# EasyEDA Pro project ProProject_25电赛备赛_2025-07-07.epro, board PCB30_1
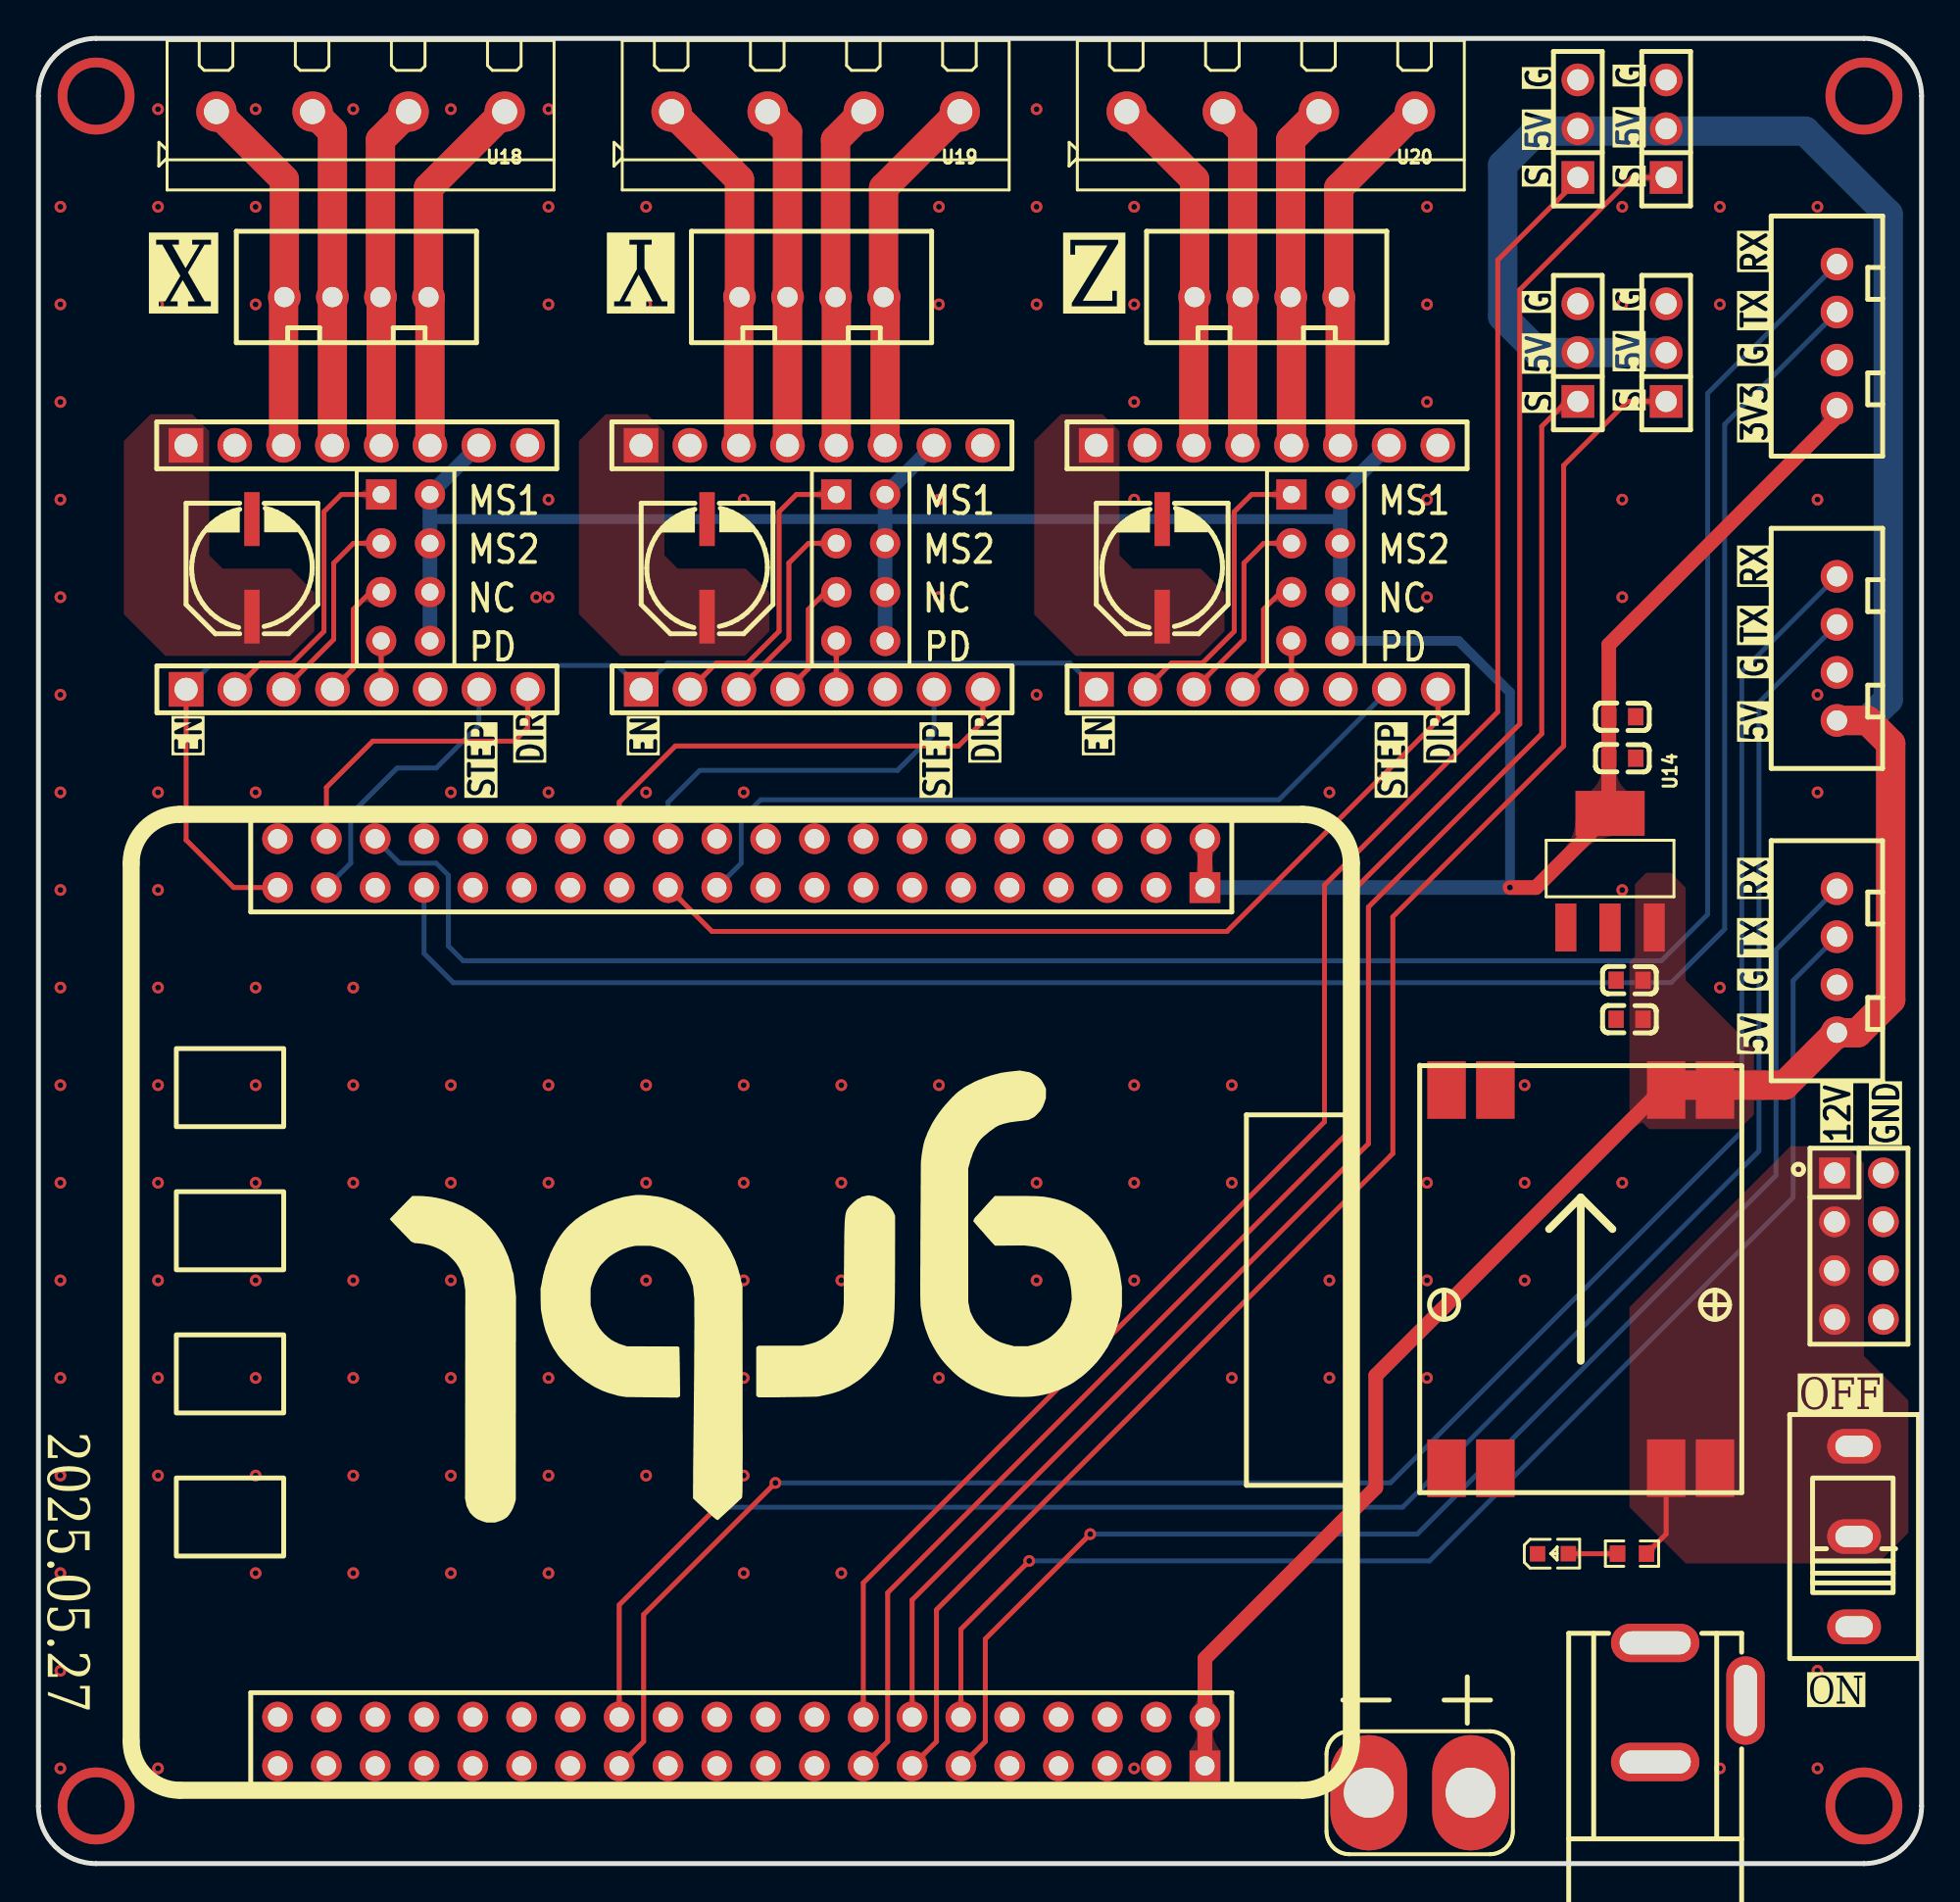
[diagram p4: board, top side]
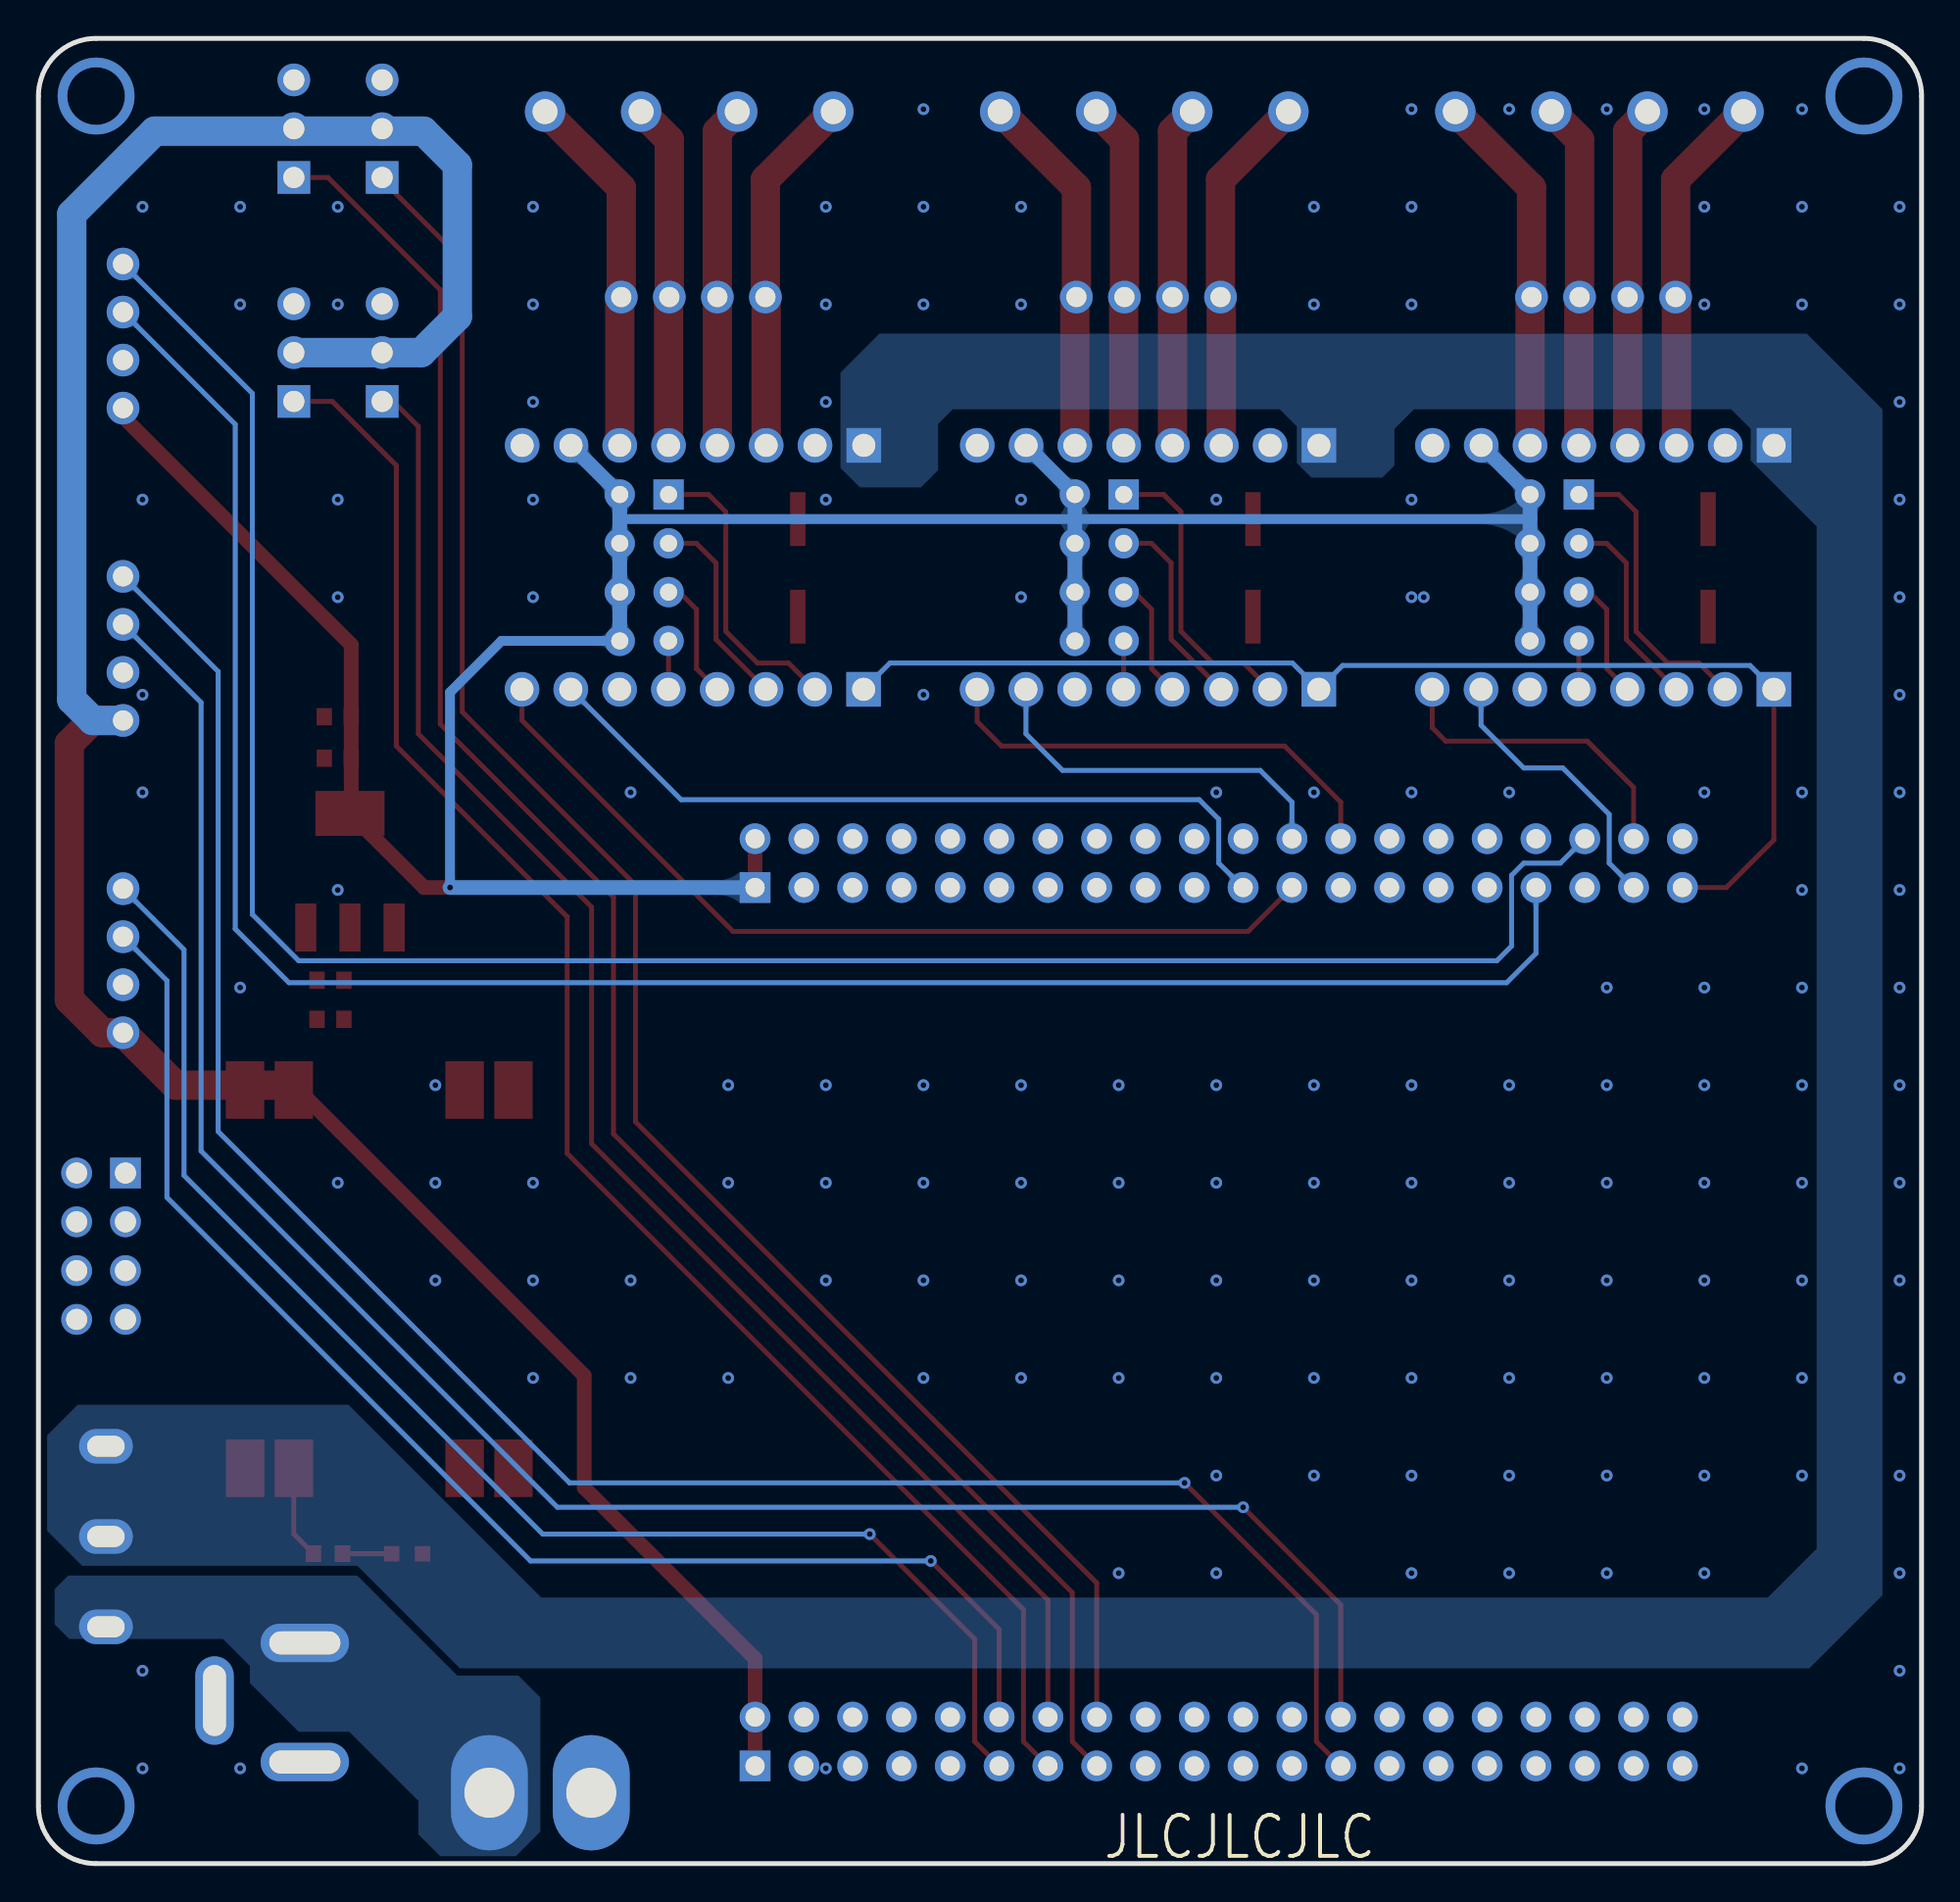
[diagram p5: board, bottom side, seen from below]

Outline 98 x 95 mm; copper layers: Top Layer, Bottom Layer. Coordinates in mm from the lower left corner of the outline.
Outline path: 0,92 0,3 arc(0.88,0.88) 3,0 95,0 arc(97.12,0.88) 98,3 98,92 arc(97.12,94.12) 95,95 3,95 arc(0.88,94.12) 0,92
Stack: Top Layer 0.035mm / Dielectric1 1.51mm FR4 er 4.5 / Bottom Layer 0.035mm

## Design rules (mm)
template: 自定义配置
spacing copperThickness1oz (default): track to track 0.102, other pairs 0.152 to 0.3
spacing copperThickness2oz: track to track 0.203, other pairs 0.152 to 0.3
track width copperThickness1oz (default): min 0.127, default 0.254, max 2.54
track width copperThickness2oz: min 0.203, default 0.254, max 2.54
differential pair differentialPair (default): width min 0.127, default 0.254, max 2.54; gap min 0.152, default 0.152
via viaSize (default): diameter min 0.5, default 0.61, max 10; hole min 0.3, default 0.305, max 6.3

## Placement (name value [footprint] x y rotation side)
C3  100nF  [C0603]  82.8 43.95 0 top
C4  10uF  [C0603]  82.8 45.98 0 top
C41  100nF  [C0603]  82.42 57.53 180 top
C42  10uF  [C0603]  82.42 59.69 180 top
DC2  DC005  [DC-IN-TH_DC005]  86.49 8.39 90 top
DCIN1  T型插头  [wired t-header throughhole]  71.88 3.69 270 top
H1  -  [HDR-TH_8P-P2.54-V-F-R2-C4-S2.54-1]  94.74 32.14 270 top
H2  -  [HDR-TH_3P-P2.54-V-M]  80.11 90.3 90 top
H3  -  [HDR-TH_3P-P2.54-V-M]  84.71 90.3 90 top
H4  -  [HDR-TH_3P-P2.54-V-M]  80.11 78.65 90 top
H5  -  [HDR-TH_3P-P2.54-V-M]  84.71 78.65 90 top
H6  -  [HDR-TH_8P-P2.54-V-F-1]  40.26 61.12 0 top
H7  -  [HDR-TH_8P-P2.54-V-F-1]  40.25 73.82 0 top
H8  -  [HDR-TH_8P-P2.54-V-F-1]  16.58 61.12 0 top
H9  -  [HDR-TH_8P-P2.54-V-F-1]  16.57 73.82 0 top
H10  -  [HDR-TH_8P-P2.54-V-F-1]  63.95 61.12 0 top
H11  -  [HDR-TH_8P-P2.54-V-F-1]  63.94 73.82 0 top
LED1  -  [LED_0603]  78.87 16.13 0 top
MC13  100uF(35V)  [CAP-D6.3XH5.5]  11.11 67.44 270 top
MC14  100uF(35V)  [CAP-D6.3XH5.5]  34.8 67.44 270 top
MC19  100uF(35V)  [CAP-D6.3XH5.5]  58.48 67.44 270 top
MJ1  HDR-M-2.54_2x4  [HDR-M-2.54_2X4]  19.11 67.45 270 top
MJ2  HDR-M-2.54_2x4  [HDR-M-2.54_2X4]  42.79 67.45 270 top
MJ3  HDR-M-2.54_2x4  [HDR-M-2.54_2X4]  66.48 67.45 270 top
R1  10K  [R0603]  82.93 16.13 180 top
U1  336682cdb138453f91beae0ae56ac6f0  [f4核心板]  36.58 29.21 270 top
U2  xh2.54-4p(直针)  [CONN-TH_4P-P2.50-XH2.54-4P]  16.55 81.54 180 top
U3  xh2.54-4p(直针)  [CONN-TH_4P-P2.50-XH2.54-4P]  40.23 81.54 180 top
U4  xh2.54-4p(直针)  [CONN-TH_4P-P2.50-XH2.54-4P]  63.92 81.54 180 top
U6  xh2.54-4p(直针)  [CONN-TH_4P-P2.50-XH2.54-4P]  93.6 46.99 270 top
U7  xh2.54-4p(直针)  [CONN-TH_4P-P2.50-XH2.54-4P]  93.6 63.25 270 top
U8  xh2.54-4p(直针)  [CONN-TH_4P-P2.50-XH2.54-4P]  93.6 79.51 270 top
U9  -  [mp1584]  88.65 19.31 90 top
U14  AMS1117-3.3  [SOT-223-3_L6.5-W3.4-P2.30-LS7.0-BR]  81.79 51.69 270 top
U18  -  [KF301_4P]  16.76 91.19 180 top
U19  -  [KF301_4P]  40.45 91.19 180 top
U20  -  [KF301_4P]  64.13 91.19 180 top
U21  SS-12D10G4  [SW-TH_HOOYA_SS-12D10G4]  94.49 17.02 90 top

## Footprints (pads in the part's own frame, mm; a bottom-side part is the same pattern mirrored in y, then rotated)
C0603
  rect 0.8x0.9 smd: 1(-0.7,0) 2(0.7,0)
CAP-D6.3XH5.5
  rect 2.8x0.8 smd: 1(2.54,0) 2(-2.54,0)
CONN-TH_4P-P2.50-XH2.54-4P
  round 1.7 hole 1.05: 1(3.75,0) 2(1.25,0) 3(-1.25,0) 4(-3.75,0)
DC-IN-TH_DC005
  oval 2x4.6 hole 1.2x3.7: 1(3.1,2.35) 2(-3.1,2.35)
  oval 4.6x2 hole 3.7x1.2: 3(0.1,-2.35)
f4核心板
  rect 1.6x1.6 hole 1: 1(-21.59,24.13) 41(24.13,24.13)
  round 1.6 hole 1: 2(-24.13,24.13) 3(-21.59,21.59) 4(-24.13,21.59) 5(-21.59,19.05) 6(-24.13,19.05) 7(-21.59,16.51) 8(-24.13,16.51) 9(-21.59,13.97) 10(-24.13,13.97) 11(-21.59,11.43) 12(-24.13,11.43) 13(-21.59,8.89) 14(-24.13,8.89) 15(-21.59,6.35) 16(-24.13,6.35) 17(-21.59,3.81) 18(-24.13,3.81) 19(-21.59,1.27) 20(-24.13,1.27) 21(-21.59,-1.27) 22(-24.13,-1.27) 23(-21.59,-3.81) 24(-24.13,-3.81) 25(-21.59,-6.35) 26(-24.13,-6.35) 27(-21.59,-8.89) 28(-24.13,-8.89) 29(-21.59,-11.43) 30(-24.13,-11.43) 31(-21.59,-13.97) 32(-24.13,-13.97) 33(-21.59,-16.51) 34(-24.13,-16.51) 35(-21.59,-19.05) 36(-24.13,-19.05) 37(-21.59,-21.59) 38(-24.13,-21.59) 39(-21.59,-24.13) 40(-24.13,-24.13) 42(21.59,24.13) 43(24.13,21.59) 44(21.59,21.59) 45(24.13,19.05) 46(21.59,19.05) 47(24.13,16.51) 48(21.59,16.51) 49(24.13,13.97) 50(21.59,13.97) 51(24.13,11.43) 52(21.59,11.43) 53(24.13,8.89) 54(21.59,8.89) 55(24.13,6.35) 56(21.59,6.35) 57(24.13,3.81) 58(21.59,3.81) 59(24.13,1.27) 60(21.59,1.27) 61(24.13,-1.27) 62(21.59,-1.27) 63(24.13,-3.81) 64(21.59,-3.81) 65(24.13,-6.35) 66(21.59,-6.35) 67(24.13,-8.89) 68(21.59,-8.89) 69(24.13,-11.43) 70(21.59,-11.43) 71(24.13,-13.97) 72(21.59,-13.97) 73(24.13,-16.51) 74(21.59,-16.51) 75(24.13,-19.05) 76(21.59,-19.05) 77(24.13,-21.59) 78(21.59,-21.59) 79(24.13,-24.13) 80(21.59,-24.13)
HDR-M-2.54_2X4
  rect 1.575x1.575 hole 0.889: 1(-3.81,-1.27)
  round 1.575 hole 0.889: 2(-3.81,1.27) 3(-1.27,-1.27) 4(-1.27,1.27) 5(1.27,-1.27) 6(1.27,1.27) 7(3.81,-1.27) 8(3.81,1.27)
HDR-TH_3P-P2.54-V-M
  rect 1.7x1.7 hole 1.1: 1(-2.54,0)
  round 1.7 hole 1.1: 2(0,0) 3(2.54,0)
HDR-TH_8P-P2.54-V-F-1
  rect 1.8x1.8 hole 1.2: 1(-8.89,0)
  round 1.8 hole 1.2: 2(-6.35,0) 3(-3.81,0) 4(-1.27,0) 5(1.27,0) 6(3.81,0) 7(6.35,0) 8(8.89,0)
HDR-TH_8P-P2.54-V-F-R2-C4-S2.54-1
  rect 1.6x1.6 hole 1.1: 1(-3.81,-1.27)
  round 1.6 hole 1.1: 2(-3.81,1.27) 3(-1.27,-1.27) 4(-1.27,1.27) 5(1.27,-1.27) 6(1.27,1.27) 7(3.81,-1.27) 8(3.81,1.27)
KF301_4P
  round 2.1 hole 1.3: 1(-7.5,0) 2(-2.5,0) 3(2.5,0) 4(7.5,0)
LED_0603
  rect 0.8x0.8 smd: 1(-0.851,-0.01) 2(0.75,-0.005)
mp1584
  rect 3x2 smd: 1(1.27,15.367) 2(1.27,12.827) 3(20.955,15.367) 4(20.955,12.827) 5(1.27,3.937) 6(1.27,1.397) 7(20.955,3.937) 8(20.955,1.397)
R0603
  rect 0.806x0.864 smd: 1(-0.753,0) 2(0.753,0)
SOT-223-3_L6.5-W3.4-P2.30-LS7.0-BR
  rect 2.5x1.1 smd: 1(2.97,-2.3) 2(2.97,0) 3(2.97,2.3)
  rect 2.34x3.6 smd: 4(-2.97,0)
SW-TH_HOOYA_SS-12D10G4
  oval 1.8x2.8 hole 1.1x1.95: 1(-4.7,0) 2(0,0) 3(4.7,0)
wired t-header throughhole
  rrect 6x4 hole 2.6: 1(0,2.65) 2(0,-2.65)

## Nets
3V3: C41.2 C42.2 H7.7 H9.7 H11.7 MJ1.2 MJ1.4 MJ1.6 MJ1.8 MJ2.2 MJ2.4 MJ2.6 MJ2.8 MJ3.2 MJ3.4 MJ3.6 MJ3.8 U1.1 U1.2 U8.1 U14.4
5V: C3.2 C4.2 H2.2 H3.2 H4.2 H5.2 U1.41 U1.42 U6.1 U7.1 U9.7 U9.8 U14.3
GND: C3.1 C4.1 C41.1 C42.1 DC2.2 DC2.3 DCIN1.2 H1.2 H1.4 H1.6 H1.8 H2.3 H3.3 H4.3 H5.3 H6.6 H7.2 H7.8 H8.6 H9.2 H9.8 H10.6 H11.2 H11.8 LED1.1 MC13.2 MC14.2 MC19.2 U1.3 U1.4 U1.43 U1.44 U1.45 U1.77 U1.78 U6.2 U7.2 U8.2 U9.1 U9.2 U9.3 U9.4 U14.1
PVCC: H1.1 H1.3 H1.5 H1.7 H7.1 H9.1 H11.1 MC13.1 MC14.1 MC19.1 R1.1 U9.5 U9.6 U21.2 U21.3
VCC_IN: DC2.1 DCIN1.1 U21.1
PA0: U1.31
PA1: U1.34
PA2: U1.33 U8.3
PA3: U1.36 U8.4
PA4: U1.35
PA5: H8.8 U1.38
PA6: H8.7 U1.37
PA7: U1.40
PA8: U1.48
PA9: U1.47
PA10: U1.46
PA15: U1.6
PB1: U1.76
PB3: U1.18
PB4: U1.17
PB5: U1.20
PB6: U1.19
PB7: U1.22
PB8: H10.7 U1.21
PB9: H6.7 U1.24
PB10: U1.66 U7.3
PB11: U1.65 U7.4
PB12: U1.64
PB13: U1.63
PB14: U1.62
PB15: U1.61
PC4: H6.1 H8.1 H10.1 U1.39
PC6: U1.52 U6.3
PC7: U1.51 U6.4
PC8: U1.50
PC9: U1.49
PC10: U1.5
PC11: U1.8
PC12: U1.7
PC13: U1.32
PD0: U1.10
PD1: U1.9
PD2: U1.12
PD3: U1.11
PD4: U1.14
PD5: U1.13
PD6: U1.16
PD7: U1.15
PD8: U1.60
PD9: U1.59
PD10: U1.58
PD11: U1.57
PD12: H2.1 U1.56
PD13: H3.1 U1.55
PD14: H4.1 U1.54
PD15: H5.1 U1.53
PE0: H10.8 U1.23
PE1: H6.8 U1.26
PE2: U1.25
PE3: U1.28
PE4: U1.27
PE5: U1.30
PE6: U1.29
PE7: U1.75
PE8: U1.74
PE9: U1.73
PE10: U1.72
PE11: U1.71
PE12: U1.70
PE13: U1.69
PE14: U1.68
PE15: U1.67
X_1A: H9.5 U2.3 U18.2
X_1B: H9.6 U2.4 U18.1
X_2A: H9.4 U2.2 U18.3
X_2B: H9.3 U2.1 U18.4
X_MS1: H8.2 MJ1.1
X_MS2: H8.3 MJ1.3
X_NC: H8.4 MJ1.5
X_PD: H8.5 MJ1.7
Y_1A: H7.5 U3.3 U19.2
Y_1B: H7.6 U3.4 U19.1
Y_2A: H7.4 U3.2 U19.3
Y_2B: H7.3 U3.1 U19.4
Y_MS1: H6.2 MJ2.1
Y_MS2: H6.3 MJ2.3
Y_NC: H6.4 MJ2.5
Y_PD: H6.5 MJ2.7
Z_1A: H11.5 U4.3 U20.2
Z_1B: H11.6 U4.4 U20.1
Z_2A: H11.4 U4.2 U20.3
Z_2B: H11.3 U4.1 U20.4
Z_MS1: H10.2 MJ3.1
Z_MS2: H10.3 MJ3.3
Z_NC: H10.4 MJ3.5
Z_PD: H10.5 MJ3.7
$1N6428: LED1.2 R1.2

Pads without a net: U1 79 80; U14 2

## Via types
v1: diameter 4, hole 3, Top Layer to Bottom Layer, 4 vias
v2: diameter 0.61, hole 0.305, Top Layer to Bottom Layer, 152 vias

## Routing (per net, layer and track width the routed paths; a pad name or vN(x,y) marks a point on that pad's centre or on a via; arc(x,y) is an arc through that point)
3V3: length 152.4
  Top Layer w0.762: v2(76.58,50.8) 77.93,50.8 U14.4 81.72,54.73 C41.2 C42.2 81.72,63.44 93.6,75.31 U8.1 ; U1.1 U1.2
  Bottom Layer w0.508: 20.38,69.98 67.74,69.98 67.75,69.97 ; MJ3.8 73.9,63.64 76.58,60.96 v2(76.58,50.8)
  Bottom Layer w0.762: H9.7 20.38,71.28 MJ1.4 MJ1.6 MJ1.8 ; MJ2.8 MJ2.6 MJ2.4 MJ2.2 44.06,71.28 H7.7 ; MJ3.8 MJ3.6 MJ3.4 67.75,71.28 H11.7 ; v2(76.58,50.8) U1.1
5V: length 143.7
  Top Layer w0.762: U1.41 U1.42 60.71,10.67 69.6,19.56 69.6,25.4 84.71,40.52
  Top Layer w1.524: U7.1 95.19,59.5 96.39,58.3 96.39,44.96 94.68,43.24 U6.1 90.87,40.52 84.71,40.52
  Bottom Layer w1.524: H5.2 H4.2 78.07,78.65 76.2,80.52 76.2,88.42 77.96,90.17 91.95,90.17 96.27,85.86 96.27,60.58 95.18,59.5 U7.1
GND:
  vias: v2(1.14,86.24) v2(1.14,81.16) v2(1.14,76.08) v2(1.14,71) v2(1.14,65.92) v2(1.14,60.84) v2(1.14,55.76) v2(1.14,50.68) v2(1.14,45.6) v2(1.14,40.52) v2(1.14,35.44) v2(1.14,30.36) v2(1.14,25.28) v2(1.14,20.2) v2(1.14,15.12) v2(1.14,10.04) v2(1.14,4.96) v2(6.22,91.32) v2(6.22,86.24) v2(6.22,81.16) v2(6.22,55.76) v2(6.22,50.68) v2(6.22,45.6) v2(6.22,40.52) v2(6.22,35.44) v2(6.22,30.36) v2(6.22,25.28) v2(6.22,20.2) v2(6.22,4.96) v2(11.3,91.32) v2(11.3,86.24) v2(11.3,81.16) v2(11.3,55.76) v2(11.3,45.6) v2(11.3,40.52) v2(11.3,35.44) v2(11.3,30.36) v2(11.3,25.28) v2(11.3,20.2) v2(11.3,15.12) v2(16.38,91.32) v2(16.38,45.6) v2(16.38,40.52) v2(16.38,35.44) v2(16.38,30.36) v2(16.38,25.28) v2(16.38,20.2) v2(16.38,15.12) v2(21.46,91.32) v2(21.46,55.76) v2(21.46,40.52) v2(21.46,35.44) v2(21.46,30.36) v2(21.46,25.28) v2(21.46,20.2) v2(21.46,15.12) v2(25.91,65.92) v2(26.54,91.32) v2(26.54,86.24) v2(26.54,81.16) v2(26.54,71) v2(26.54,65.92) v2(26.54,55.76) v2(26.54,40.52) v2(26.54,35.44) v2(26.54,30.36) v2(26.54,25.28) v2(26.54,20.2) v2(26.54,15.12) v2(31.62,86.24) v2(31.62,81.16) v2(31.62,55.76) v2(31.62,40.52) v2(31.62,35.44) v2(31.62,30.36) v2(31.62,25.28) v2(31.62,20.2) v2(36.7,71) v2(36.7,55.76) v2(36.7,40.52) v2(36.7,35.44) v2(36.7,30.36) v2(36.7,25.28) v2(36.7,20.2) v2(36.7,15.12) v2(41.78,40.52) v2(41.78,35.44) v2(41.78,30.36) v2(41.78,25.28) v2(41.78,15.12) v2(46.86,86.24) v2(46.86,81.16) v2(46.86,71) v2(46.86,65.92) v2(46.86,40.52) v2(46.86,35.44) v2(46.86,30.36) v2(46.86,25.28) v2(51.94,91.32) v2(51.94,86.24) v2(51.94,81.16) v2(51.94,60.84) v2(51.94,40.52) v2(51.94,35.44) v2(51.94,30.36) v2(51.94,25.28) v2(57.02,86.24) v2(57.02,81.16) v2(57.02,76.08) v2(57.02,71) v2(57.02,40.52) v2(57.02,35.44) v2(57.02,30.36) v2(57.02,4.96) v2(62.1,40.52) v2(62.1,35.44) v2(62.1,25.28) v2(67.18,55.76) v2(67.18,30.36) v2(67.18,25.28) v2(72.26,86.24) v2(72.26,81.16) v2(72.26,76.08) v2(72.26,71) v2(72.26,65.92) v2(72.26,35.44) v2(72.26,30.36) v2(72.26,25.28) v2(77.34,40.52) v2(77.34,35.44) v2(77.34,30.36) v2(82.42,86.24) v2(82.42,81.16) v2(82.42,71) v2(82.42,65.92) v2(82.42,50.68) v2(82.42,35.44) v2(87.5,86.24) v2(87.5,81.16) v2(87.5,45.6) v2(87.5,4.96) v2(92.58,86.24) v2(92.58,71) v2(92.58,60.84) v2(92.58,55.76) v2(92.58,10.04) v2(92.58,4.96)
PVCC: length 5.1
  Top Layer w0.254: 84.71,20.83 84.71,17.16 R1.1
(no net):
  vias: v1(3,92) v1(3,3) v1(95,92) v1(95,3)
PA2: length 107.4
  Bottom Layer w0.254: U8.3 87.76,74.91 87.76,48.64 84.96,45.85 21.59,45.85 20.07,47.38 U1.33
PA3: length 111.8
  Bottom Layer w0.254: U8.4 86.87,76.53 86.87,49.41 84.46,46.99 22.1,46.99 21.34,47.76 21.34,51.44 20.7,52.07 18.8,52.07 U1.36
PA5: length 16.4
  Top Layer w0.254: H8.8 25.47,59.12 24.77,58.42 17.4,58.42 14.99,56.01 U1.38
PA6: length 14.8
  Bottom Layer w0.254: H8.7 22.93,59.25 20.7,57.03 18.67,57.03 16.26,54.61 16.26,52.07 U1.37
PB8: length 40.6
  Bottom Layer w0.254: H10.7 64.55,55.38 37.59,55.38 36.58,54.36 36.58,52.07 U1.21
PB9: length 19.5
  Bottom Layer w0.254: H6.7 46.61,61.12 46.61,58.81 44.7,56.9 34.42,56.9 32.77,55.25 U1.24
PB10: length 104
  Top Layer w0.254: U1.66 30.23,13.47 v2(35.31,18.55)
  Bottom Layer w0.254: v2(35.31,18.55) 70.99,18.55 89.53,37.09 89.53,60.44 U7.3
PB11: length 106.9
  Top Layer w0.254: U1.65 31.5,6.35 31.5,12.96 v2(38.35,19.82)
  Bottom Layer w0.254: U7.4 88.65,62.05 88.65,38.1 70.36,19.82 v2(38.35,19.82)
PC4: length 63.2
  Top Layer w0.254: H8.1 7.69,53.28 10.16,50.8 U1.39
  Bottom Layer w0.254: H8.1 8.93,62.36 30.13,62.36 31.37,61.12 32.74,62.49 53.69,62.49 H10.1
PC6: length 71.7
  Top Layer w0.254: U1.52 48.01,12.2 v2(51.56,15.75)
  Bottom Layer w0.254: v2(51.56,15.75) 72.39,15.75 91.31,34.67 91.31,45.96 U6.3
PC7: length 74.5
  Top Layer w0.254: v2(54.74,17.15) 49.28,11.69 49.28,6.35 U1.51
  Bottom Layer w0.254: U6.4 90.42,47.57 90.42,35.82 71.75,17.15 v2(54.74,17.15)
PD12: length 95.4
  Top Layer w0.254: 80.11,87.63 75.95,83.47 75.95,59.95 66.93,50.93 66.93,38.61 42.93,14.61 U1.56
PD13: length 101
  Top Layer w0.254: U1.55 44.2,6.35 44.2,14.1 68.07,37.98 68.07,50.3 77.09,59.31 77.09,81.92 82.93,87.76 H3.1
PD14: length 83.2
  Top Layer w0.254: U1.54 45.47,13.72 69.22,37.47 69.22,49.79 78.23,58.81 78.23,74.81 79.53,76.11 H4.1
PD15: length 88.5
  Top Layer w0.254: U1.53 46.74,6.35 46.74,13.21 70.49,36.96 70.49,49.28 79.38,58.17 79.38,72.78 82.71,76.11 H5.1
PE0: length 47.2
  Top Layer w0.254: U1.23 35.05,48.52 61.85,48.52 72.84,59.51 H10.8
PE1: length 24.2
  Top Layer w0.254: H6.8 49.15,61.12 49.15,59.44 47.88,58.17 33.15,58.17 30.23,55.25 U1.26
X_1A: length 18
  Top Layer w1.524: 17.88,81.54 17.84,81.5 H9.5 ; U18.2 17.8,89.72 U2.3
X_1B: length 19.1
  Top Layer w1.524: U18.1 20.3,87.22 U2.4 20.33,81.54 20.38,81.5 H9.6
X_2A: length 17.8
  Top Layer w1.524: U18.3 15.3,90.16 U2.2 ; H9.4 15.3,81.5 15.34,81.54
X_2B: length 18.9
  Top Layer w1.524: H9.3 12.76,81.5 U2.1 12.8,87.66 U18.4
X_MS1: length 15.5
  Top Layer w0.254: H8.2 11.59,62.49 13.21,62.49 14.86,64.14 14.86,70.36 15.76,71.26 MJ1.1
X_MS2: length 10.5
  Top Layer w0.254: H8.3 15.37,63.72 15.37,67.69 16.39,68.72 MJ1.3
X_NC: length 6.4
  Top Layer w0.254: H8.4 16.38,62.2 16.38,65.28 17.28,66.18 MJ1.5
X_PD: length 2.5
  Top Layer w0.254: MJ1.7 17.84,61.13 H8.5
Y_1A: length 18
  Top Layer w1.524: U19.2 41.48,89.72 U3.3 ; H7.5 41.52,81.5 41.56,81.54
Y_1B: length 19.1
  Top Layer w1.524: 44.06,81.5 44.1,81.54 ; 44.06,81.5 44.02,81.54 U3.4 43.98,87.22 U19.1 ; 44.06,81.5 H7.6
Y_2A: length 17.8
  Top Layer w1.524: U3.2 38.98,90.16 U19.3 ; H7.4 38.98,81.5 39.02,81.54
Y_2B: length 18.9
  Top Layer w1.524: U19.4 36.48,87.66 U3.1 36.44,81.5 H7.3
Y_MS1: length 15.5
  Top Layer w0.254: H6.2 35.28,62.49 36.89,62.49 38.54,64.14 38.54,70.36 39.44,71.26 MJ2.1
Y_MS2: length 10.5
  Top Layer w0.254: H6.3 39.05,63.72 39.05,67.69 40.08,68.72 MJ2.3
Y_NC: length 6.4
  Top Layer w0.254: H6.4 40.07,62.2 40.07,65.28 40.97,66.18 MJ2.5
Y_PD: length 2.5
  Top Layer w0.254: H6.5 41.52,61.13 MJ2.7
Z_1A: length 18
  Top Layer w1.524: U20.2 65.17,89.72 U4.3 ; H11.5 65.21,81.5 65.25,81.54
Z_1B: length 19.1
  Top Layer w1.524: U20.1 67.67,87.22 U4.4 67.71,81.54 67.75,81.5 H11.6
Z_2A: length 17.8
  Top Layer w1.524: U4.2 62.67,90.16 U20.3 ; 62.71,81.54 62.67,81.5 H11.4
Z_2B: length 18.9
  Top Layer w1.524: H11.3 60.13,81.5 U4.1 60.17,87.66 U20.4
Z_MS1: length 15.5
  Top Layer w0.254: H10.2 58.97,62.49 60.58,62.49 62.23,64.14 62.23,70.36 63.13,71.26 MJ3.1
Z_MS2: length 10.5
  Top Layer w0.254: MJ3.3 63.76,68.72 62.74,67.69 62.74,63.72 H10.3
Z_NC: length 6.4
  Top Layer w0.254: MJ3.5 64.65,66.18 63.75,65.28 63.75,62.2 H10.4
Z_PD: length 2.5
  Top Layer w0.254: MJ3.7 65.21,61.13 H10.5
$1N6428: length 2.6
  Top Layer w0.254: R1.2 82.17,16.13 LED1.2

## Copper pours and planes (outline as drawn; the poured copper is in the pictures)
5V on Top Layer: 82.8,51.57 89.28,51.57 89.28,38.23 82.8,38.23
GND on Top Layer: -9.78,97.92 104.52,97.92 104.52,-8.38 -9.78,-8.38
GND on Bottom Layer: -9.02,107.83 103.25,107.83 103.25,-5.2 -9.02,-5.2
PVCC on Top Layer: 28.13,75.44 38.04,75.44 38.04,62.87 28.13,62.87
PVCC on Top Layer: 4.44,75.44 14.35,75.44 14.35,62.87 4.44,62.87
PVCC on Top Layer: 82.8,37.34 97.31,37.34 97.31,15.62 82.8,15.62
PVCC on Top Layer: 51.82,75.44 61.72,75.44 61.72,62.87 51.82,62.87
PVCC on Bottom Layer: 4.57,79.63 56.26,79.63 56.26,71.63 4.57,71.63
PVCC on Bottom Layer: 2.03,78.24 97.55,78.24 97.55,10.16 2.03,10.16
VCC_IN on Bottom Layer: 71.88,14.99 97.16,14.99 97.16,0.38 71.88,0.38

Small or netless copper shapes (teardrops, artwork), in the pictures only: 78 on Top Layer, 48 on Bottom Layer

## Text on the board
Bottom Silkscreen Layer: JLCJLCJLC
Top Silkscreen Layer: EN | STEP | DIR | G | 5V | S | RX | TX | 3V3 | 12V | GND | NC | MS2 | MS1 | PD | ON | OFF | 2025.05.27 | X | Y | Z
